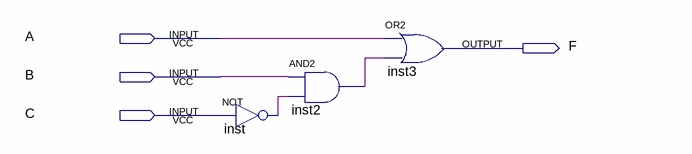
[diagram p0: schematic sheet]
// Quartus schematic block_example.bdf as structural Verilog: 3 symbols, 4 pins
module block_example (
  input  A,
  input  B,
  input  C,
  output F
);

  wire inst2_out, inst_out;

  not inst (inst_out, C);
  and inst2 (inst2_out, B, inst_out);
  or inst3 (F, A, inst2_out);
endmodule
